# Altium schematic sheet Power.SchDoc
size A; SheetNumber: 2; SheetTotal: 2
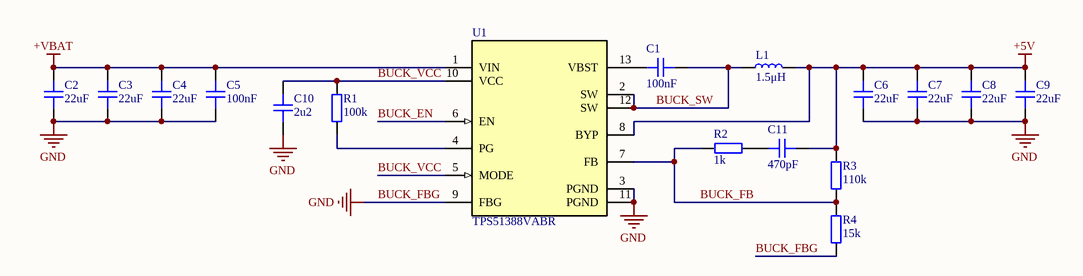
[diagram p0: Power.SchDoc]

## Parts
C1  100nF  [CAP_0603]
C2  22uF  [CAP_0805]
C3  22uF  [CAP_0805]
C4  22uF  [CAP_0805]
C5  100nF  [CAP_0603]
C6  22uF  [CAP_0805]
C7  22uF  [CAP_0805]
C8  22uF  [CAP_0805]
C9  22uF  [CAP_0805]
C10  2u2  [CAP_0603]
C11  470pF  [CAP_0603]
L1  1.5μH  [XGL5050]
R1  100k  [RES_0603]
R2  1k  [RES_0603]
R3  110k  [RES_0603]
R4  15k  [RES_0603]
U1  TPS51388VABR  [VAB0013A-MFG]

## Nets
+5V: C6.2 C7.2 C8.2 C9.2 C11.2 L1.2 R3.2 U1.8(BYP)
+VBAT: C2.2 C3.2 C4.2 C5.2 U1.1(VIN)
BUCK_FBG: C2.1 C3.1 C4.1 C5.1 C6.1 C7.1 C8.1 C9.1 C10.1 R4.1 U1.3(PGND) U1.9(FBG) U1.11(PGND)  [also labelled GND]
BUCK_EN: U1.6(EN)
BUCK_FB: R2.1 R3.1 R4.2 U1.7(FB)
BUCK_SW: C1.2 L1.1 U1.2(SW) U1.12(SW)
BUCK_VCC: C10.2 R1.2 U1.5(MODE) U1.10(VCC)
NetC1_1: C1.1 U1.13(VBST)
NetC11_1: C11.1 R2.2
NetR1_1: R1.1 U1.4(PG)

## Library data of the parts
C1 C5 C10 C11 = CAP_0603: Capacitor SMD 0603; Manufacturer: *; Manufacturer Part Number: *; Distributor Link: *; LCSC: *; Rating: *; Dielectric: *
C2-C4 C6-C9 = CAP_0805: Capacitor SMD 0805; Manufacturer: *; Manufacturer Part Number: *; Distributor Link: *; LCSC: *; Rating: *; Dielectric: *
L1 = XGL5050-152MEC: 1.5 µH Shielded Molded Inductor 17.1 A 5.7mOhm Max Nonstandard
R1-R4 = RES_0603: Resistor SMD 0603; Manufacturer: *; Manufacturer Part Number: *; Distributor Link: *; LCSC: *
U1 = TPS51388VABR: 4.5-V to 24-V input, 12-A synchronous buck converter with adjustable output 13-VQFN-HR -40 to 125; Manufacturer_Name: Texas Instruments; TYPE: TYPE; RefDes: RefDes; Copyright: Copyright (C) 2025 Ultra Librarian. All rights reserved.; Manufacturer_Part_Number: TPS51388VABR; Supplier 1: Mouser; Supplier Part Number 1: 595-TPS51388VABR